# Altium schematic sheet 16MV1.SchDoc
size A3
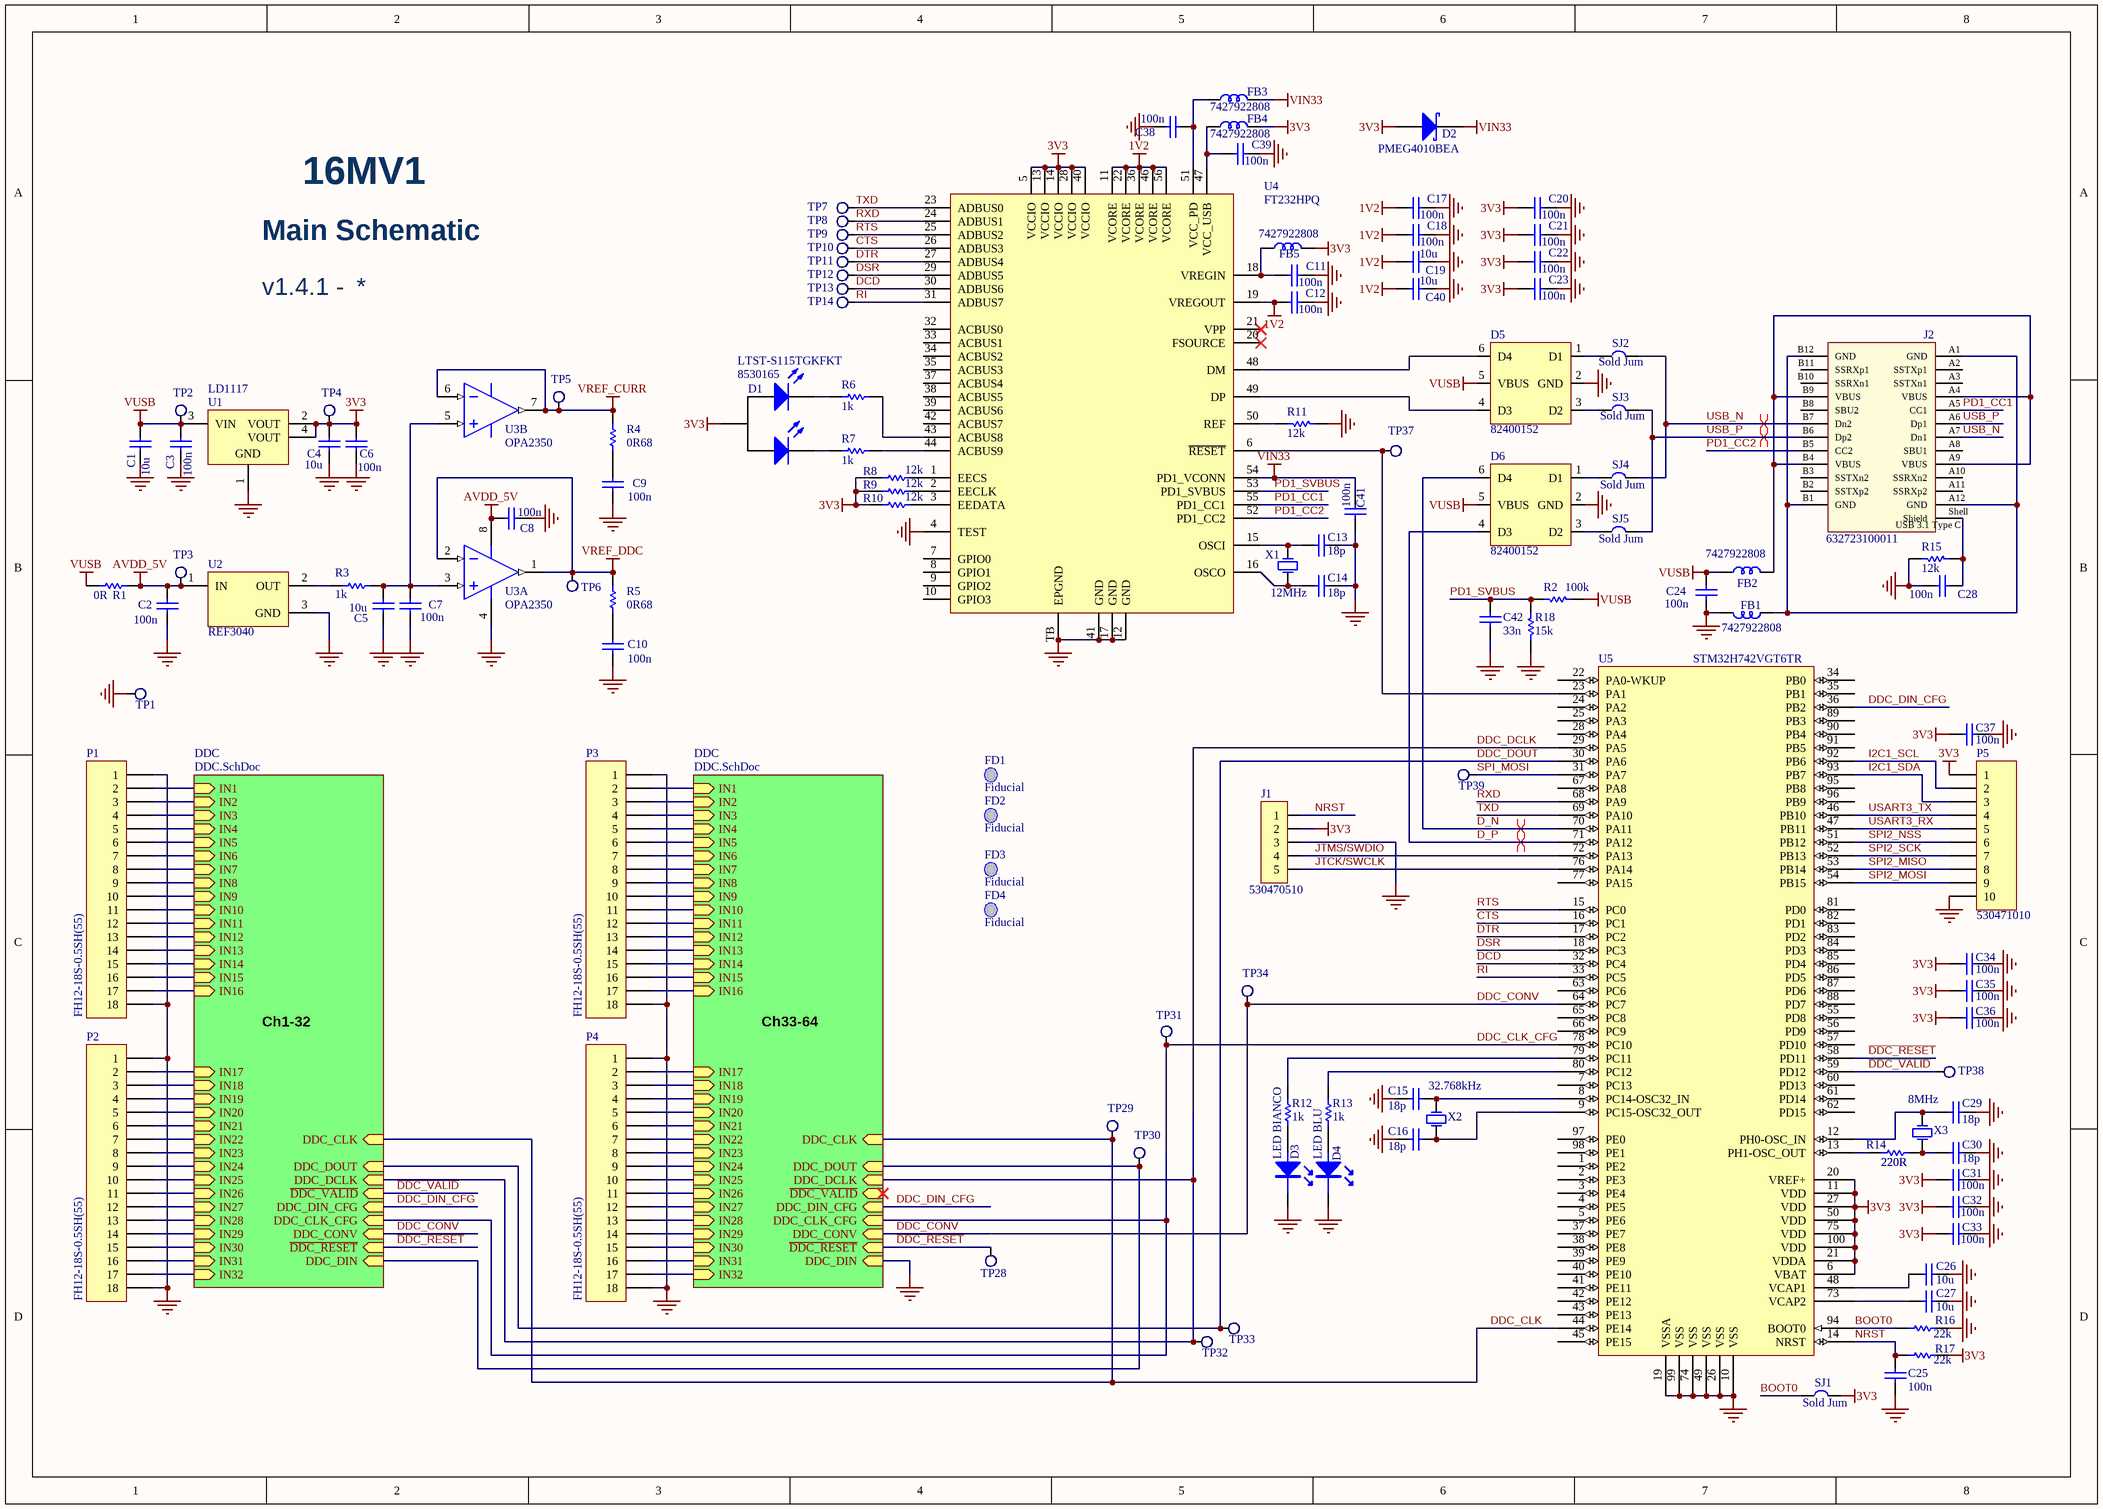
[diagram p0: 16MV1.SchDoc]

## Parts
C1  10u  [0603]
C2  100n  [0402]
C3  100n  [0402]
C4  10u  [0603]
C5  10u  [0603]
C6  100n  [0402]
C7  100n  [0402]
C8  100n  [0402]
C9  100n  [0402]
C10  100n  [0402]
C11  100n  [0402]
C12  100n  [0402]
C13  18p  [0402]
C14  18p  [0402]
C15  18p  [0402]
C16  18p  [0402]
C17  100n  [0402]
C18  100n  [0402]
C19  10u  [0603]
C20  100n  [0402]
C21  100n  [0402]
C22  100n  [0402]
C23  100n  [0402]
C24  100n  [0402]
C25  100n  [0402]
C26  10u  [0603]
C27  10u  [0603]
C28  100n  [0402]
C29  18p  [0402]
C30  18p  [0402]
C31  100n  [0402]
C32  100n  [0402]
C33  100n  [0402]
C34  100n  [0402]
C35  100n  [0402]
C36  100n  [0402]
C37  100n  [0402]
C38  100n  [0402]
C39  100n  [0402]
C40  10u  [0603]
C41  100n  [0402]
C42  value 33n  [0402]  (hidden comment: 18p)
D1  LTST-S115TGKFKT  Supplier Part Number 1: 8530165  [LED BICOLOR R/A SMD]
D2  PMEG4010BEA  [SOD-323]
D3  LED BIANCO  [LED_SMD]
D4  LED BLU  [LED_SMD]
D5  82400152  [SOT-666]
D6  82400152  [SOT-666]
FB1  7427922808  [0603]
FB2  7427922808  [0603]
FB3  7427922808  [0402]
FB4  7427922808  [0402]
FB5  7427922808  [0402]
FD1  Fiducial  [FIDUCIAL]
FD2  Fiducial  [FIDUCIAL]
FD3  Fiducial  [FIDUCIAL]
FD4  Fiducial  [FIDUCIAL]
J1  530470510  [MOLEX_5_V]
J2  632723100011  [632723100011]
P1  FH12-18S-0.5SH(55)  [FH12-18S-0.5SH(55)]
P2  FH12-18S-0.5SH(55)  [FH12-18S-0.5SH(55)]
P3  FH12-18S-0.5SH(55)  [FH12-18S-0.5SH(55)]
P4  FH12-18S-0.5SH(55)  [FH12-18S-0.5SH(55)]
P5  530471010  [MOLEX_10_V]
R1  0R  [0402]
R2  100k  [0402]
R3  1k  [0402]
R4  0R68  [0402]
R5  0R68  [0402]
R6  1k  [0402]
R7  1k  [0402]
R8  12k  [0402]
R9  12k  [0402]
R10  12k  [0402]
R11  12k  [0402]
R12  1k  [0402]
R13  1k  [0402]
R14  220R  [0402]
R15  12k  [0402]
R16  22k  [0402]
R17  22k  [0402]
R18  15k  [0402]
SJ1  Sold Jum  [SolderJumpMini]
SJ2  Sold Jum  [SolderJumpMini]
SJ3  Sold Jum  [SolderJumpMini]
SJ4  Sold Jum  [SolderJumpMini]
SJ5  Sold Jum  [SolderJumpMini]
TP1  TestPoint  [PIAZZOLA]  (value not drawn)
TP2  TestPoint  [PIAZZOLA]  (value not drawn)
TP3  TestPoint  [PIAZZOLA]  (value not drawn)
TP4  TestPoint  [PIAZZOLA]  (value not drawn)
TP5  TestPoint  [PIAZZOLA]  (value not drawn)
TP6  TestPoint  [PIAZZOLA]  (value not drawn)
TP7  TestPoint  [PIAZZOLA]  (value not drawn)
TP8  TestPoint  [PIAZZOLA]  (value not drawn)
TP9  TestPoint  [PIAZZOLA]  (value not drawn)
TP10  TestPoint  [PIAZZOLA]  (value not drawn)
TP11  TestPoint  [PIAZZOLA]  (value not drawn)
TP12  TestPoint  [PIAZZOLA]  (value not drawn)
TP13  TestPoint  [PIAZZOLA]  (value not drawn)
TP14  TestPoint  [PIAZZOLA]  (value not drawn)
TP28  TestPoint  [PIAZZOLA]  (value not drawn)
TP29  TestPoint  [PIAZZOLA]  (value not drawn)
TP30  TestPoint  [PIAZZOLA]  (value not drawn)
TP31  TestPoint  [PIAZZOLA]  (value not drawn)
TP32  TestPoint  [PIAZZOLA]  (value not drawn)
TP33  TestPoint  [PIAZZOLA]  (value not drawn)
TP34  TestPoint  [PIAZZOLA]  (value not drawn)
TP37  TestPoint  [PIAZZOLA]  (value not drawn)
TP38  TestPoint  [PIAZZOLA]  (value not drawn)
TP39  TestPoint  [PIAZZOLA]  (value not drawn)
U1  LD1117  [SOT223-4M]
U2  REF3040  [SOT23-3L]
U3  OPA2350  [MSOP8]  (parts A,B of 2)
U4  FT232HPQ  [QFN56]
U5  STM32H742VGT6TR  [QFP50P1600X1600X160-100N]
X1  12MHz  [XTAL_SMD3225]
X2  32.768kHz  [XTAL FC-13]
X3  8MHz  [XTAL_SMD3225]

## Sub-sheets
DDC = DDC.SchDoc: IN1 (in), IN2 (in), IN3 (in), IN4 (in), IN5 (in), IN6 (in), IN7 (in), IN8 (in), IN9 (in), IN10 (in), IN11 (in), IN12 (in), IN13 (in), IN14 (in), IN15 (in), IN16 (in), IN17 (in), IN18 (in), IN19 (in), IN20 (in), IN21 (in), IN22 (in), IN23 (in), IN24 (in), IN25 (in), IN26 (in), IN27 (in), IN28 (in), IN29 (in), IN30 (in), IN31 (in), IN32 (in), ~{DDC_RESET} (in), DDC_CONV (in), DDC_DIN_CFG (in), DDC_CLK_CFG (in), DDC_CLK (in), DDC_DCLK (in), DDC_DIN (in), DDC_DOUT (in), ~{DDC_VALID} (in)
DDC = DDC.SchDoc: IN1 (in), IN2 (in), IN3 (in), IN4 (in), IN5 (in), IN6 (in), IN7 (in), IN8 (in), IN9 (in), IN10 (in), IN11 (in), IN12 (in), IN13 (in), IN14 (in), IN15 (in), IN16 (in), IN17 (in), IN18 (in), IN19 (in), IN20 (in), IN21 (in), IN22 (in), IN23 (in), IN24 (in), IN25 (in), IN26 (in), IN27 (in), IN28 (in), IN29 (in), IN30 (in), IN31 (in), IN32 (in), ~{DDC_RESET} (in), DDC_CONV (in), DDC_DIN_CFG (in), DDC_CLK_CFG (in), DDC_CLK (in), DDC_DCLK (in), DDC_DIN (in), DDC_DOUT (in), ~{DDC_VALID} (in)

## Nets
1V2: C12.1 C17.1 C18.1 C19.2 C40.2 U4.11(VCORE) U4.19(VREGOUT) U4.22(VCORE) U4.36(VCORE) U4.46(VCORE) U4.56(VCORE)
3V3: C4.1 C6.1 C20.1 C21.1 C22.1 C23.1 C31.1 C32.1 C33.1 C34.1 C35.1 C36.1 C37.1 D1.1(A) D2.1(A) FB4.2 FB5.2 J1.2 P5.1 R8.2 R9.2 R10.2 R17.2 SJ1.1 TP4.1 U1.2(VOUT) U1.4(VOUT) U4.5(VCCIO) U4.13(VCCIO) U4.14(VCCIO) U4.28(VCCIO) U4.40(VCCIO) U5.6(VBAT) U5.11(VDD) U5.20(VREF+) U5.21(VDDA) U5.27(VDD) U5.50(VDD) U5.75(VDD) U5.100(VDD)
AVDD_5V: C2.1 C8.1 R1.1 TP3.1 U2.1(IN) U3.8(V+)
GND: C1.2 C2.2 C3.2 C4.2 C5.2 C6.2 C7.2 C8.2 C9.2 C10.2 C11.2 C12.2 C13.1 C14.1 C15.2 C16.2 C17.2 C18.2 C19.1 C20.2 C21.2 C22.2 C23.2 C24.2 C25.2 C26.1 C27.1 C28.2 C29.1 C30.1 C31.2 C32.2 C33.2 C34.2 C35.2 C36.2 C37.2 C38.2 C39.2 C40.1 C41.1 C42.1 D3.2(K) D4.2(K) D5.2(GND) D6.2(GND) FB1.2 J1.3 P1.1 P1.18 P2.1 P2.18 P3.1 P3.18 P4.1 P4.18 P5.10 R11.2 R15.1 R16.2 R18.1 TP1.1 U1.1(GND) U2.3(GND) U3.4(V-) U4.4(TEST) U4.12(GND) U4.17(GND) U4.41(GND) U4.TB(EPGND) U5.10(VSS) U5.19(VSSA) U5.26(VSS) U5.49(VSS) U5.74(VSS) U5.99(VSS) ; sheet DDC/DDC_DIN
VIN33: C41.2 D2.2(K) FB3.2 U4.54(PD1_VCONN)
VREF_CURR: R4.2 TP5.1 U3.6(IN_B-) U3.7(OUT_B)
VREF_DDC: R5.2 TP6.1 U3.1(OUT_A) U3.2(IN_A-)
VUSB: C1.1 C3.1 C24.1 D5.5(VBUS) D6.5(VBUS) FB2.1 R1.2 R2.2 TP2.1 U1.3(VIN)
BOOT0: R16.1 SJ1.2 U5.94(BOOT0)
CTS: TP10.1 U4.26(ADBUS3) U5.16(PC1)
~{DDC_RESET}: TP28.1 U5.58(PD11) ; sheet DDC/~{DDC_RESET}, sheet DDC/~{DDC_RESET}
~{DDC_VALID}: TP38.1 U5.59(PD12) ; sheet DDC/~{DDC_VALID}
D_N: D6.6(D4) U5.70(PA11)
D_P: D6.4(D3) U5.71(PA12)
DCD: TP13.1 U4.30(ADBUS6) U5.32(PC4)
DDC_CLK: TP29.1 U5.44(PE14) ; sheet DDC/DDC_CLK, sheet DDC/DDC_CLK
DDC_CLK_CFG: TP31.1 U5.78(PC10) ; sheet DDC/DDC_CLK_CFG, sheet DDC/DDC_CLK_CFG
DDC_CONV: TP34.1 U5.64(PC7) ; sheet DDC/DDC_CONV, sheet DDC/DDC_CONV
DDC_DCLK: TP32.1 U5.29(PA5) ; sheet DDC/DDC_DCLK, sheet DDC/DDC_DCLK
DDC_DIN_CFG: U5.36(PB2) ; sheet DDC/DDC_DIN_CFG, sheet DDC/DDC_DIN_CFG
DDC_DOUT: TP33.1 U5.30(PA6) ; sheet DDC/DDC_DOUT
DSR: TP12.1 U4.29(ADBUS5) U5.18(PC3)
DTR: TP11.1 U4.27(ADBUS4) U5.17(PC2)
I2C1_SCL: P5.2 U5.92(PB6)
I2C1_SDA: P5.3 U5.93(PB7)
JTCK/SWCLK: J1.5 U5.76(PA14)
JTMS/SWDIO: J1.4 U5.72(PA13)
NRST: C25.1 J1.1 R17.1 U5.14(NRST)
PD1_CC1: J2.A5(CC1) U4.55(PD1_CC1)
PD1_CC2: J2.B5(CC2) U4.52(PD1_CC2)
PD1_SVBUS: C42.2 R2.1 R18.2 U4.53(PD1_SVBUS)
RI: TP14.1 U4.31(ADBUS7) U5.33(PC5)
RTS: TP9.1 U4.25(ADBUS2) U5.15(PC0)
RXD: TP8.1 U4.24(ADBUS1) U5.68(PA9)
SPI2_MISO: P5.8 U5.53(PB14)
SPI2_MOSI: P5.9 U5.54(PB15)
SPI2_NSS: P5.6 U5.51(PB12)
SPI2_SCK: P5.7 U5.52(PB13)
SPI_MOSI: TP39.1 U5.31(PA7)
TXD: TP7.1 U4.23(ADBUS0) U5.69(PA10)
USART3_RX: P5.5 U5.47(PB11)
USART3_TX: P5.4 U5.46(PB10)
USB_N: J2.A7(Dn1) J2.B7(Dn2) SJ2.1 SJ4.1
USB_P: J2.A6(Dp1) J2.B6(Dp2) SJ3.1 SJ5.1
NetC5_1: C5.1 C7.1 R3.1 U3.3(IN_A+) U3.5(IN_B+)
NetC9_1: C9.1 R4.1
NetC10_1: C10.1 R5.1
NetC11_1: C11.1 FB5.1 U4.18(VREGIN)
NetC13_2: C13.2 U4.15(OSCI) X1.3(OSC2)
NetC14_2: C14.2 U4.16(OSCO) X1.1(OSC1)
NetC15_1: C15.1 U5.8(PC14-OSC32_IN) X2.2(OSC2)
NetC16_1: C16.1 U5.9(PC15-OSC32_OUT) X2.1(OSC1)
NetC26_2: C26.2 U5.48(VCAP1)
NetC27_2: C27.2 U5.73(VCAP2)
NetC28_1: C28.1 J2.Shell(Shield) R15.2
NetC29_2: C29.2 U5.12(PH0-OSC_IN) X3.3(OSC2)
NetC30_2: C30.2 R14.2 X3.1(OSC1)
NetC38_1: C38.1 FB3.1 U4.51(VCC_PD)
NetC39_1: C39.1 FB4.1 U4.47(VCC_USB)
NetD1_2: D1.2(KR) R7.1
NetD1_3: D1.3(KG) R6.1
NetD3_1: D3.1(A) R12.1
NetD4_1: D4.1(A) R13.1
NetD5_1: D5.1(D1) SJ2.2
NetD5_3: D5.3(D2) SJ3.2
NetD5_4: D5.4(D3) U4.49(DP)
NetD5_6: D5.6(D4) U4.48(DM)
NetD6_1: D6.1(D1) SJ4.2
NetD6_3: D6.3(D2) SJ5.2
NetFB1_1: FB1.1 J2.A1(GND) J2.A12(GND) J2.B1(GND) J2.B12(GND)
NetFB2_2: FB2.2 J2.A4(VBUS) J2.A9(VBUS) J2.B4(VBUS) J2.B9(VBUS)
NetP1_2: P1.2 ; sheet DDC/IN1
NetP1_3: P1.3 ; sheet DDC/IN2
NetP1_4: P1.4 ; sheet DDC/IN3
NetP1_5: P1.5 ; sheet DDC/IN4
NetP1_6: P1.6 ; sheet DDC/IN5
NetP1_7: P1.7 ; sheet DDC/IN6
NetP1_8: P1.8 ; sheet DDC/IN7
NetP1_9: P1.9 ; sheet DDC/IN8
NetP1_10: P1.10 ; sheet DDC/IN9
NetP1_11: P1.11 ; sheet DDC/IN10
NetP1_12: P1.12 ; sheet DDC/IN11
NetP1_13: P1.13 ; sheet DDC/IN12
NetP1_14: P1.14 ; sheet DDC/IN13
NetP1_15: P1.15 ; sheet DDC/IN14
NetP1_16: P1.16 ; sheet DDC/IN15
NetP1_17: P1.17 ; sheet DDC/IN16
NetP2_2: P2.2 ; sheet DDC/IN17
NetP2_3: P2.3 ; sheet DDC/IN18
NetP2_4: P2.4 ; sheet DDC/IN19
NetP2_5: P2.5 ; sheet DDC/IN20
NetP2_6: P2.6 ; sheet DDC/IN21
NetP2_7: P2.7 ; sheet DDC/IN22
NetP2_8: P2.8 ; sheet DDC/IN23
NetP2_9: P2.9 ; sheet DDC/IN24
NetP2_10: P2.10 ; sheet DDC/IN25
NetP2_11: P2.11 ; sheet DDC/IN26
NetP2_12: P2.12 ; sheet DDC/IN27
NetP2_13: P2.13 ; sheet DDC/IN28
NetP2_14: P2.14 ; sheet DDC/IN29
NetP2_15: P2.15 ; sheet DDC/IN30
NetP2_16: P2.16 ; sheet DDC/IN31
NetP2_17: P2.17 ; sheet DDC/IN32
NetP3_2: P3.2 ; sheet DDC/IN1
NetP3_3: P3.3 ; sheet DDC/IN2
NetP3_4: P3.4 ; sheet DDC/IN3
NetP3_5: P3.5 ; sheet DDC/IN4
NetP3_6: P3.6 ; sheet DDC/IN5
NetP3_7: P3.7 ; sheet DDC/IN6
NetP3_8: P3.8 ; sheet DDC/IN7
NetP3_9: P3.9 ; sheet DDC/IN8
NetP3_10: P3.10 ; sheet DDC/IN9
NetP3_11: P3.11 ; sheet DDC/IN10
NetP3_12: P3.12 ; sheet DDC/IN11
NetP3_13: P3.13 ; sheet DDC/IN12
NetP3_14: P3.14 ; sheet DDC/IN13
NetP3_15: P3.15 ; sheet DDC/IN14
NetP3_16: P3.16 ; sheet DDC/IN15
NetP3_17: P3.17 ; sheet DDC/IN16
NetP4_2: P4.2 ; sheet DDC/IN17
NetP4_3: P4.3 ; sheet DDC/IN18
NetP4_4: P4.4 ; sheet DDC/IN19
NetP4_5: P4.5 ; sheet DDC/IN20
NetP4_6: P4.6 ; sheet DDC/IN21
NetP4_7: P4.7 ; sheet DDC/IN22
NetP4_8: P4.8 ; sheet DDC/IN23
NetP4_9: P4.9 ; sheet DDC/IN24
NetP4_10: P4.10 ; sheet DDC/IN25
NetP4_11: P4.11 ; sheet DDC/IN26
NetP4_12: P4.12 ; sheet DDC/IN27
NetP4_13: P4.13 ; sheet DDC/IN28
NetP4_14: P4.14 ; sheet DDC/IN29
NetP4_15: P4.15 ; sheet DDC/IN30
NetP4_16: P4.16 ; sheet DDC/IN31
NetP4_17: P4.17 ; sheet DDC/IN32
NetR3_2: R3.2 U2.2(OUT)
NetR6_2: R6.2 U4.43(ACBUS8)
NetR7_2: R7.2 U4.44(ACBUS9)
NetR8_1: R8.1 U4.1(EECS)
NetR9_1: R9.1 U4.2(EECLK)
NetR10_1: R10.1 U4.3(EEDATA)
NetR11_1: R11.1 U4.50(REF)
NetR12_2: R12.2 U5.79(PC11)
NetR13_2: R13.2 U5.80(PC12)
NetR14_1: R14.1 U5.13(PH1-OSC_OUT)
NetTP30_1: TP30.1 ; sheet DDC/DDC_DIN, sheet DDC/DDC_DOUT
NetTP37_1: TP37.1 U4.6(~{RESET}) U5.23(PA1)

Not connected (* = marked no-connect by the designer): J2 A2(SSTXp1) A3(SSTXn1) A8(SBU1) A10(SSRXn2) A11(SSRXp2) B2(SSTXp2) B3(SSTXn2) B8(SBU2) B10(SSRXn1) B11(SSRXp1); U4 7(GPIO0) 8(GPIO1) 9(GPIO2) 10(GPIO3) 20(FSOURCE)* 21(VPP)* 32(ACBUS0) 33(ACBUS1) 34(ACBUS2) 35(ACBUS3) 37(ACBUS4) 38(ACBUS5) 39(ACBUS6) 42(ACBUS7); U5 1(PE2) 2(PE3) 3(PE4) 4(PE5) 5(PE6) 7(PC13) 22(PA0-WKUP) 24(PA2) 25(PA3) 28(PA4) 34(PB0) 35(PB1) 37(PE7) 38(PE8) 39(PE9) 40(PE10) 41(PE11) 42(PE12) 43(PE13) 45(PE15) 55(PD8) 56(PD9) 57(PD10) 60(PD13) 61(PD14) 62(PD15) 63(PC6) 65(PC8) 66(PC9) 67(PA8) 77(PA15) 81(PD0) 82(PD1) 83(PD2) 84(PD3) 85(PD4) 86(PD5) 87(PD6) 88(PD7) 89(PB3) 90(PB4) 91(PB5) 95(PB8) 96(PB9) 97(PE0) 98(PE1)

## Layout directives
differential pair: D_N, D_P, USB_N, USB_P

## Notes on the sheet
- Main Schematic
- 16MV1
- v1.4.1 -
- Ch1-32
- Ch33-64
- (in symbol 632723100011) USB 3.1 Type C

## Library data of the parts
C1 C4 C5 C19 C26 C27 C40 = Cap 10uF: Capacitor X5R 6.3V 10%; Published: 8-Jun-2000; LatestRevisionDate: 17-Jul-2002; LatestRevisionNote: Re-released for DXP Platform.; Publisher: Altium Limited
C2 C3 C6-C12 C17 C18 C20-C25 C28 C31-C39 C41 = Cap 100nF: Capacitor X7R 50V 10%; Published: 8-Jun-2000; LatestRevisionDate: 17-Jul-2002; LatestRevisionNote: Re-released for DXP Platform.; Publisher: Altium Limited
  C31-C37: PackageReference: RAD-0.3; PackageDescription: Radial Cap, Thru-Hole; 2 Leads; 0.3 in Pin Spacing; Value: 100n
C13-C16 C29 C30 C42 = Cap 18pF: Capacitor COG 50V 10%; Published: 8-Jun-2000; LatestRevisionDate: 17-Jul-2002; LatestRevisionNote: Re-released for DXP Platform.; PackageReference: RAD-0.3; Publisher: Altium Limited; PackageDescription: Radial Cap, Thru-Hole; 2 Leads; 0.3 in Pin Spacing
  C13-C16 C29 C30: Value: 18p
D1 = Led Bicolor 4: Led bicolor Right angle; Supplier 1: Farnell
D2 = PMEG4010BEA: Schottky Diode; Code - JEDEC: DO-214-AA; Produttore: ON SEMICONDUCTOR; Published: 8-Jun-2000; Revision: July-2002: Re-released for DXP Platform.; Publisher: Altium Limited; Supplier 1: Digi-Key; Supplier Part Number 1: 1727-5211-6-ND; Supplier 2: Mouser; Supplier Part Number 2: 771-PMEG4010BEAT/R
D3 = LED BIANCO: LED, QuasarBrite, bianco, SMD, 2mm x 1,6mm, 20 mA, 3.5 V, 90 mcd; Supplier 1: Digi-Key; Supplier Part Number 1: 67-1866-1-ND; Supplier 2: Farnell; Supplier Part Number 2: 2062228
D4 = LED BLU: LED, BLUE, 3.2MM X 1.6MM, 25MCD, 470NM; Supplier 1: Digi-Key; Supplier Part Number 1: 67-1701-1-ND; Supplier 2: Farnell; Supplier Part Number 2: 1020463
D5 D6 = 82400152: WE-TVS TVS Diode – High speed Series; Supplier 1: Digi-Key; Supplier Part Number 1: 732-4474-1-ND; Supplier 2: Farnell; Supplier Part Number 2: 1825874
FB1-FB5 = 7427922808: Ferrite bead; Supplier 1: Digi-Key; Supplier Part Number 1: 732-6114-1-ND; Supplier 2: Farnell; Supplier Part Number 2: 2467183
J1 = Header 5: Header, 5-Pin; Supplier 1: Digi-Key; Supplier Part Number 1: WM1734-ND; Supplier 2: Farnell; Supplier Part Number 2: 9732861
J2 = 632723100011: USB 3.1 Type C Receptacle Horizontal THR WR-COM; Interface Type: Type C; Sub-Family: USB 3.1; ComponentLink1Description: Manufacturer; ComponentLink1URL: http://www.we-online.de; ComponentLink2Description: Datasheet; ComponentLink2URL: http://katalog.we-online.de/em/datasheet/632723x00011.pdf; Part Number: 632723100011; Published Date: April 2017; Publisher: Wurth Elektronik; Gender: Receptacle; Type: Horizontal; Construction: THR; Supplier 1: Digi-Key; Supplier 2: Farnell; Supplier Part Number 1: 732-9617-1-ND; Supplier Part Number 2: 2984360
P1-P4 = FH12-18S-0.5SH(55): Header, 18-Pin; LatestRevisionDate: 17-Jul-2002; LatestRevisionNote: Re-released for DXP Platform.; Publisher: Altium Limited; Supplier 1: Digi-Key; Supplier 2: RSComponents; Supplier Part Number 1: HFJ118CT-ND; Supplier Part Number 2: 7388824
P5 = Header 10: Header, 10-Pin; LatestRevisionDate: 17-Jul-2002; LatestRevisionNote: Re-released for DXP Platform.; Publisher: Altium Limited; Supplier 1: Digi-Key; Supplier 2: Farnell; Supplier Part Number 1: WM1739-ND; Supplier Part Number 2: 9733086
R1 = Res 0R: Resistor 0.1W 1%; Published: 8-Jun-2000; Publisher: Altium Limited; Value: 0R; LatestRevisionDate: 17-Jul-2002; LatestRevisionNote: Re-released for DXP Platform.; PackageReference: AXIAL-0.3; PackageDescription: Axial Device, Thru-Hole; 2 Leads; 0.3 in Pin Spacing
R2 R8-R11 R15 R18 = Res 12k: Resistor 0.1W 1%; Value: 10k; Published: 8-Jun-2000; Publisher: Altium Limited; LatestRevisionDate: 17-Jul-2002; LatestRevisionNote: Re-released for DXP Platform.; PackageReference: AXIAL-0.3; PackageDescription: Axial Device, Thru-Hole; 2 Leads; 0.3 in Pin Spacing
R3 R6 R7 R12 R13 = Res 1k: Resistor 0.1W 1%; Published: 8-Jun-2000; Publisher: Altium Limited
  R3: Value: 1k; LatestRevisionDate: 17-Jul-2002; LatestRevisionNote: Re-released for DXP Platform.; PackageReference: AXIAL-0.3; PackageDescription: Axial Device, Thru-Hole; 2 Leads; 0.3 in Pin Spacing
  R6 R7 R12 R13: Revision: July-2002: Re-released for DXP Platform.
R4 R5 = Res 0R68: Resistor 0.1W 1%; Published: 8-Jun-2000; Publisher: Altium Limited; Value: 0R68; LatestRevisionDate: 17-Jul-2002; LatestRevisionNote: Re-released for DXP Platform.; PackageReference: AXIAL-0.3; PackageDescription: Axial Device, Thru-Hole; 2 Leads; 0.3 in Pin Spacing
R14 = Res 220R: Resistor 0.1W 1%; Published: 8-Jun-2000; LatestRevisionDate: 17-Jul-2002; LatestRevisionNote: Re-released for DXP Platform.; PackageReference: AXIAL-0.3; Publisher: Altium Limited; PackageDescription: Axial Device, Thru-Hole; 2 Leads; 0.3 in Pin Spacing; Value: 220R
R16 R17 = Res 22k: Resistor 0.1W 1%; Published: 8-Jun-2000; LatestRevisionDate: 17-Jul-2002; LatestRevisionNote: Re-released for DXP Platform.; Publisher: Altium Limited
SJ1-SJ5 = SJ: Solder Jumper
U1 = LD1117: Fixed Low Drop Positive Voltage Regulator, 3.3V, 4-Pin SOT-223, Tape and Reel; Manufacturer: STMicroelectronics; Manufacturer Part Number: LD1117S33CTR; ComponentLink1URL: http://www.st.com; PackageVersion: 2010; ComponentLink1Description: Manufacturer URL; DatasheetVersion: 1/11/2011; ComponentLink2URL: http://www.st.com/internet/com/TECHNICAL_RESOURCES/TECHNICAL_LITERATURE/DATASHEET/CD00000544.pdf; PackageReference: SOT-223; ComponentLink2Description: Datasheet; PackageDescription: 4-Pin SOT-223 Package, 6.5 x 3.5 mm Body, 2.3 mm Pitch, 7 mm Lead Span; Supplier 1: Digi-Key; Supplier 2: Farnell; Supplier Part Number 1: 497-1241-1-ND; Supplier Part Number 2: 1467779
U2 = REF3040: 4.096 V, 50 ppm / degC, 50 uA Series (Bandgap) Voltage Reference, -40 to 125 degC, 3-pin SOT-23 (DBZ), Green (RoHS & no Sb/Br); PartNumber: REF3040AIDBZT; Manufacturer: Texas Instruments; Temp Coeff(Max)(ppm/ degree C): 50; SubFamily: Series Voltage Reference; Temp Coeff(Typ)(ppm/ degree C): 20; Initial Accuracy @ 25/deg C(%): 0.2; VI(Max)(V): 5.5; VO(V): 4.096; VI(Min)(V): 4.097; Rating: Catalog; ComponentLink3Description: Package Specification; Iq(Max)(uA): 50; PackageVersion: 4203227/B; DatasheetVersion: SBVS032F; PackageReference: DBZ0003A; ComponentLink1URL: http://www.ti.com/; PackageDescription: 3-Pin Plastic Small Outline, Body 2.92 x 1.3 mm, Pitch 0.95 mm; Mounting Technology: Surface Mount; Eco-Plan: Green (RoHS & no Sb/Br); ComponentLink2URL: http://www.ti.com/general/docs/lit/getliterature.tsp?genericPartNumber=REF3040&fileType=pdf; Code_JEDEC: TO-236; ComponentLink1Description: Manufacturer URL; ComponentLink3URL: http://www.ti.com/litv/pdf/mpds108a; ComponentLink2Description: Datasheet; Manufacturer Part Number: REF3040AIDBZT; Supplier 1: Digi-Key; Supplier 2: Farnell; Supplier Part Number 1: REF3040AIDBZTCT-ND; Supplier Part Number 2: 3124532
U3 = OPA2350: High-Speed, Single-Supply, Rail-to-Rail Operational Amplifier MicroAmplifier(TM) Series, 2.7 to 5.5 V, -40 to 85 degC, 8-pin SOP (DGK8), Green (RoHS & no Sb/Br); PartNumber: OPA2350EA/250; Manufacturer: Texas Instruments; Number of Channels: 2; Vn at 1kHz(Typ)(nV/rtHz): 18; Offset Drift(Typ)(uV/C): 4; Slew Rate(Typ)(V/us): 22; Iq per channel(Max)(mA): 8.5; CMRR(Min)(dB): 74; Total Supply Voltage(Max)(+5V is 5, +/-5V is 10): 5.5; Vio (25C)(Max)(mV): 1; Total Supply Voltage(Min)(+5V is 5, +/-5V is 10): 2.7; IIB(Max)(pA): 10; Sub Family: Low Input Bias Current Amp (<=10pA), Low Offset Voltage Amplifier (<=500uV), Low Supply Voltage Amplifier (<=2.7V), Precision Amplifier; ComponentLink3URL: http://www.ti.com/litv/pdf/mpds028d; ComponentLink2URL: http://www.ti.com/general/docs/lit/getliterature.tsp?genericPartNumber=OPA2350&fileType=pdf; ComponentLink3Description: Package Specification; Eco-Plan: Green (RoHS & no Sb/Br); ComponentLink2Description: Datasheet; PackageVersion: 4073329/E, 05/2006; PackageDescription: 8-Pin Thin Small Outline, Body 3 x 3 mm, Pitch 0.65 mm; PackageReference: DGK0008A; Mounting Technology: Surface Mount; ComponentLink1Description: Manufacturer URL; Code_JEDEC: MO-187; ComponentLink1URL: http://www.ti.com/; DatasheetVersion: SBOS099C; Manufacturer Part Number: OPA2350EA/250; Supplier 1: Digi-Key; Supplier 2: Farnell; Supplier Part Number 1: OPA2350EACT-ND; Supplier Part Number 2: 3117460
U4 = FT232HPQ: High Speed USB Bridge with Type-C/PD3.0 / Controller; Supplier 1: Mouser; Supplier 2: Digi-Key; Supplier Part Number 1: 895-FT2232HPQ-REEL; Supplier Part Number 2: 768-FT2232HPQ-REELTR-ND
U5 = STM32F742VGT6: High-performance and DSP with DP-FPU, Arm Cortex-M7 MCU with 1MBytes of Flash memory, 692KB RAM, 480 MHz CPU, L1 cache, external memory interface, subset of peripherals; Supplier 1: Mouser; Supplier 2: Digi-Key; Supplier Part Number 1: 511-STM32H742VGT6TR; Supplier Part Number 2: 497-STM32H742VGT6TR-ND
X1 = XTAL_12MHz: Crystal Oscillator; Published: 8-Jun-2000; LatestRevisionDate: 17-Jul-2002; LatestRevisionNote: Re-released for DXP Platform.; PackageReference: R38; Publisher: Altium Limited; PackageDescription: Crystal, Thru-Hole; 2 Leads; Body 3.1 x 8.2 mm (Dia.xH); Supplier 1: Digi-Key; Supplier Part Number 1: 535-9826-6-ND; Supplier 2: Mouser; Supplier Part Number 2: 815-ABM8-12-B2-T
X2 = XTAL_32kHz: Crystal Oscillator; Published: 8-Jun-2000; LatestRevisionDate: 17-Jul-2002; LatestRevisionNote: Re-released for DXP Platform.; PackageReference: R38; Publisher: Altium Limited; Supplier 1: Digi-Key; Supplier Part Number 1: 535-9542-1-ND; Supplier 2: Mouser; Supplier Part Number 2: 815-ABS07-32.768KHZT
X3 = XTAL_8MHz: Crystal Oscillator; Published: 8-Jun-2000; LatestRevisionDate: 17-Jul-2002; LatestRevisionNote: Re-released for DXP Platform.; PackageReference: R38; Publisher: Altium Limited; PackageDescription: Crystal, Thru-Hole; 2 Leads; Body 3.1 x 8.2 mm (Dia.xH); Supplier 1: Digi-Key; Supplier Part Number 1: 535-9720-6-ND; Supplier 2: Mouser; Supplier Part Number 2: 815-ABM3B-8.0-B2-T